# Altium schematic sheet STM32C5_LQFP32_0603.SchDoc
size A
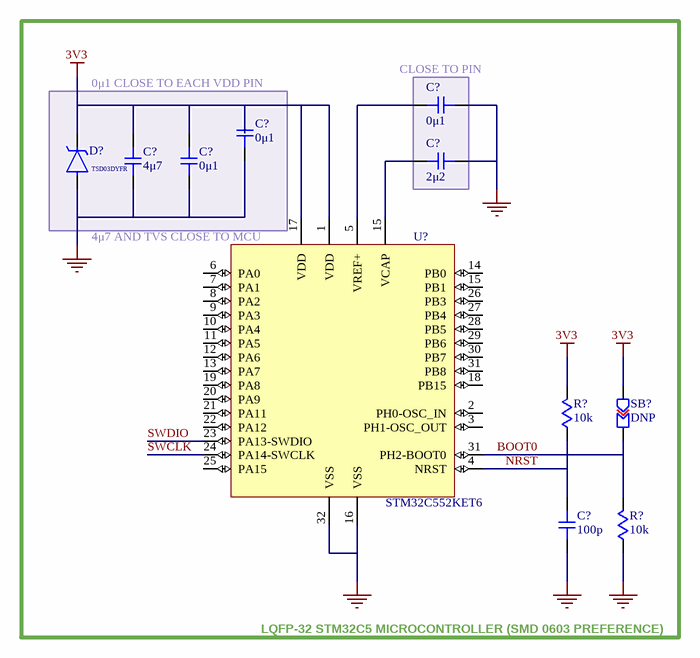
[diagram p0: STM32C5_LQFP32_0603.SchDoc]

## Parts
(Parts that share a designator on the sheet are numbered #1, #2 ... from top to bottom, then left to right.)
C?#1  0μ1  [MJB_CAP_0603]
C?#2  0μ1  [MJB_CAP_0603]
C?#3  4μ7  [MJB_CAP_0603]
C?#4  0μ1  [MJB_CAP_0603]
C?#5  2μ2  [MJB_CAP_0603]
C?#6  100p  [MJB_CAP_0603]
D?  TSD03DYFR  [MJB SOD-323]
R?#1  10k  [MJB_RES_0603]
R?#2  10k  [MJB_RES_0603]
SB?  DNP  [solder_bridge_triangular_0603_DNP]
U?  STM32C552KET6  [MJB_LQFP-32]

## Blocks framed on the sheet
0μ1 CLOSE TO EACH VDD PIN: C?#2-C?#4 D?
CLOSE TO PIN: C?#1 C?#5

## Nets
3V3: C?#2.1 C?#3.1 C?#4.1 D?.1 R?#1.2 SB?.1 U?.1(VDD) U?.17(VDD)
GND: C?#1.1 C?#2.2 C?#3.2 C?#4.2 C?#5.1 C?#6.1 D?.2 R?#2.1 U?.16(VSS) U?.32(VSS)
BOOT0: R?#2.2 SB?.2 U?.31(PB8)
NRST: C?#6.2 R?#1.1 U?.4(NRST)
SWCLK: U?.24(PA14-SWCLK)
SWDIO: U?.23(PA13-SWDIO)
NetC?#1_2: C?#1.2 U?.5(VREF+)
NetC?#5_2: C?#5.2 U?.15(PB1)

Not connected (* = marked no-connect by the designer): U? 2(PH0-OSC_IN) 3(PH1-OSC_OUT) 6(PA0) 7(PA1) 8(PA2) 9(PA3) 10(PA4) 11(PA5) 12(PA6) 13(PA7) 14(PB0) 18(PB15) 19(PA8) 20(PA9) 21(PA11) 22(PA12) 25(PA15) 26(PB3) 27(PB4) 28(PB5) 29(PB6) 30(PB7)

## Notes on the sheet
- (near U?) 4μ7 AND TVS CLOSE TO MCU
- LQFP-32 STM32C5 MICROCONTROLLER (SMD 0603 PREFERENCE)

## Library data of the parts
C?#1-C?#6 = CAP_0603: Capacitor SMD 0603; Manufacturer: *; Manufacturer Part Number: *; Distributor Link: *; LCSC: *; Rating: *; Dielectric: *
D? = TSD03DYFR: 3.3V Unidirectional TVS
R?#1 R?#2 = RES_0603: Resistor SMD 0603
SB? = solder_bridge_triangular_0603_DNP: DNP Open Solder Bridge Triangular 0603 DO NOT POPULATE
U? = STM32C552KET6: Arm Cortex-M33 32-bit MCU, 512kB Flash, 128kB RAM, LQFP-32